# Altium project SaleemD_Project.PrjPcb (part 2 of 3)

## Sheet Power_Section.SchDoc
size A4; DocumentNumber: 2; SheetNumber: 2; SheetTotal: 6
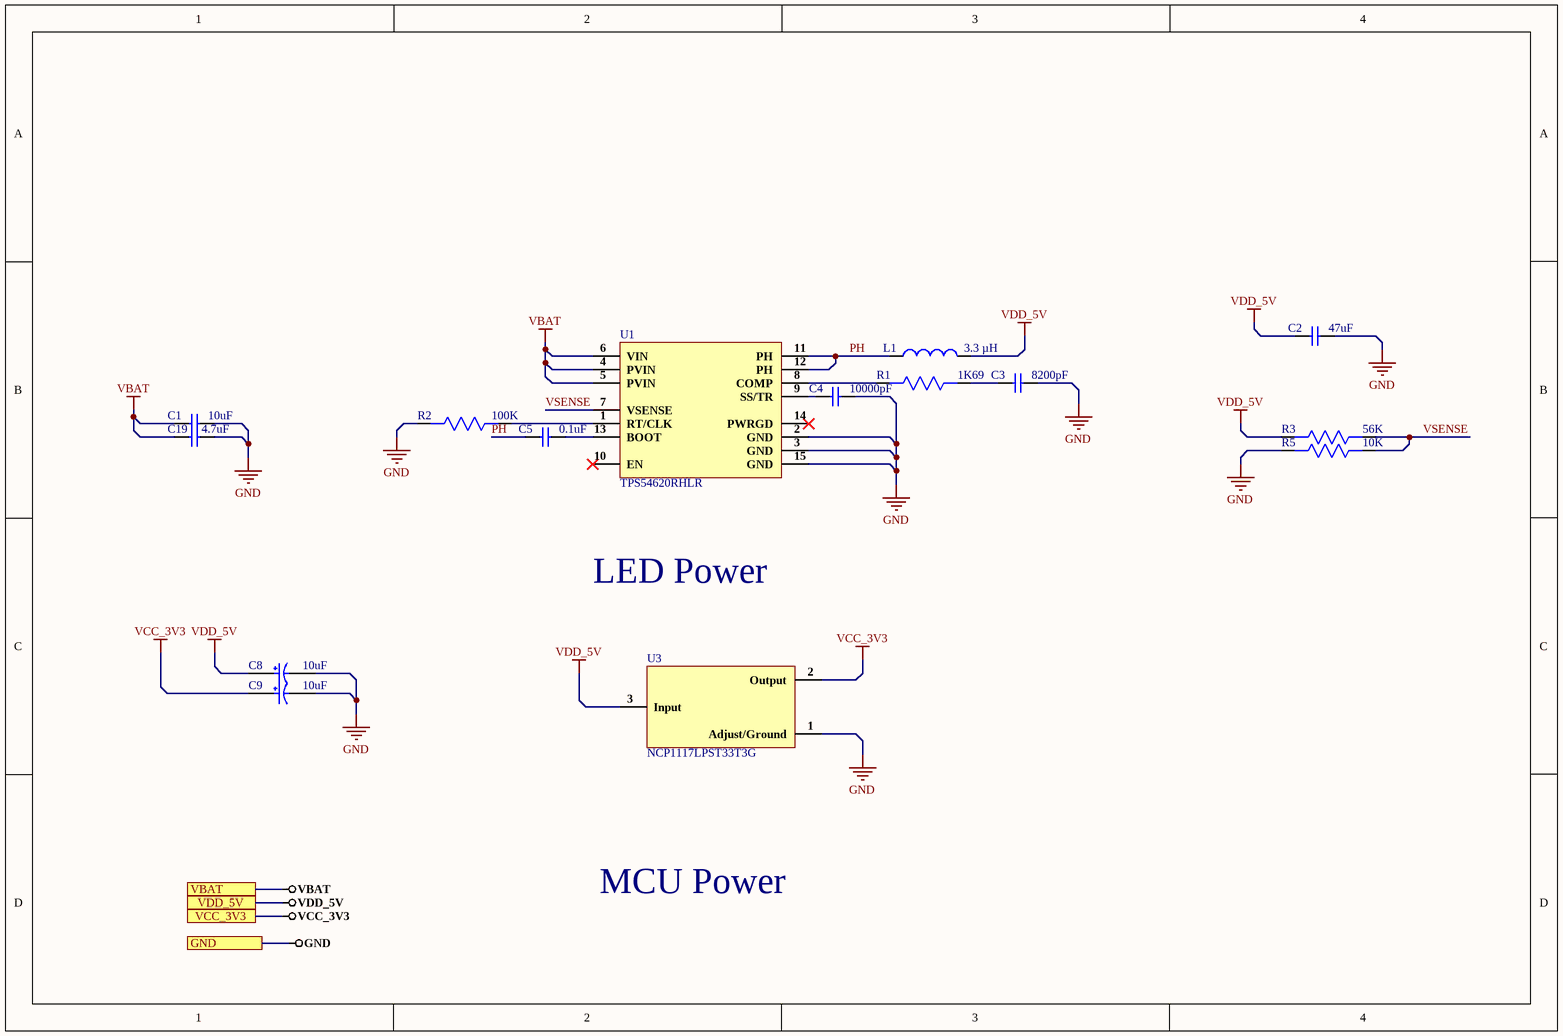
[diagram p2: Power_Section.SchDoc]

### Parts
C1  10uF  [Cap0603]
C2  47uF  [Cap1210]
C3  8200pF  [Cap0603]
C4  10000pF  [Cap0603]
C5  0.1uF  [Cap0603]
C8  10uF  [RVT1E100M0405]
C9  10uF  [RVT1E100M0405]
C19  4.7uF  [Cap0603]
L1  3.3 µH  [IHLP2525CZER3R3M01]
R1  1K69  [Res0603]
R2  100K  [Res0603]
R3  56K  [Res0603]
R5  10K  [Res0603]
U1  TPS54620RHLR  [14-VQFN (3.5x3.5)]
U3  NCP1117LPST33T3G  [SOT-223]

### Ports
GND, VBAT, VCC_3V3, VDD_5V

### Nets
GND: C1.2 C2.2 C3.2 C4.2 C8.2 C9.2 C19.2 R2.2 R5.2 U1.2(GND) U1.3(GND) U1.15(GND) U3.1(Adjust/Ground) ; port GND
VBAT: C1.1 C19.1 U1.4(PVIN) U1.5(PVIN) U1.6(VIN) ; port VBAT
VCC_3V3: C9.1 U3.2(Output) ; port VCC_3V3
VDD_5V: C2.1 C8.1 L1.2 R3.2 U3.3(Input) ; port VDD_5V
PH: C5.1 L1.1 U1.11(PH) U1.12(PH)
VSENSE: R3.1 R5.1 U1.7(VSENSE)
NetC3_1: C3.1 R1.1
NetC4_1: C4.1 U1.9(SS/TR)
NetC5_2: C5.2 U1.13(BOOT)
NetR1_2: R1.2 U1.8(COMP)
NetR2_1: R2.1 U1.1(RT/CLK)

Not connected (* = marked no-connect by the designer): U1 10(EN)* 14(PWRGD)*

### Notes on the sheet
- LED Power
- MCU Power

### Library data of the parts
C1 = GRM188R6YA106MA73D: CAP CER 10UF 35V X5R 0603; Manufacturer: Murata; Tolerance: 20%; Supplier 1: Digi-Key; Manufacturer Part Number: GRM188R6YA106MA73D; Stock 1: 11640; Pricing 1: 1=0.5, 10=0.346, 100=0.2076, 500=0.1557, 1000=0.13148 (USD); Mount: Surface Mount; Case/Package: 0603; Case Code (Metric): 1608; Case Code (Imperial): 0603; Min Operating Temperature: -55°C; Max Operating Temperature: 85°C; Packaging: Tape and Reel; Capacitance: 10uF; Voltage Rating: 35V; Voltage Rating (DC): 35V; Dielectric: X5R; Length: 0.063inch; Width: 0.031inch; Thickness: 0.039inch; ComponentLink1URL: http://search.murata.co.jp/Ceramy/image/img/A01X/G101/ENG/GRM188R6YA106MA73-01.pdf?src-supplier=Digi-Key; ComponentLink1Description: http://search.murata.co.jp/Ceramy/image/img/A01X/G101/ENG/GRM188R6YA106MA73-01.pdf?src-supplier=Digi-Key; ComponentLink2URL: http://search.murata.co.jp/Ceramy/image/img/A01X/G101/ENG/GRM188R6YA106MA73-01.pdf?src-supplier=Mouser; ComponentLink2Description: http://search.murata.co.jp/Ceramy/image/img/A01X/G101/ENG/GRM188R6YA106MA73-01.pdf?src-supplier=Mouser; ComponentLink3URL: https://www.murata.com/~/media/webrenewal/support/library/catalog/products/capacitor/mlcc/c02e.ashx?la=en-us&src-supplier=Digi-Key; ComponentLink3Description: https://www.murata.com/~/media/webrenewal/support/library/catalog/products/capacitor/mlcc/c02e.ashx?la=en-us&src-supplier=Digi-Key; ComponentLink4URL: http://search.murata.co.jp/Ceramy/image/img/A01X/G101/ENG/GRM188R6YA106MA73-01.pdf?src-supplier=Future+Electronics; ComponentLink4Description: http://search.murata.co.jp/Ceramy/image/img/A01X/G101/ENG/GRM188R6YA106MA73-01.pdf?src-supplier=Future+Electronics; ComponentLink5URL: http://search.murata.co.jp/Ceramy/image/img/A01X/G101/ENG/GRM188R6YA106MA73-01.pdf?src-supplier=TTI; ComponentLink5Description: http://search.murata.co.jp/Ceramy/image/img/A01X/G101/ENG/GRM188R6YA106MA73-01.pdf?src-supplier=TTI; Supplier Part Number 1: 490-13248-6-ND
C2 = TMK325ABJ476MM-P: CAP CER 47uF 25V 1210; Manufacturer: Taiyo Yuden; Dielectric: X5R; Tolerance: 20%; Supplier 1: RSComponents; Manufacturer Part Number: TMK325ABJ476MM-P; RoHS: Yes; Category: Ceramic Capacitors; Stock 1: 1000; Pricing 1: 1000=0.37500 (GBP); Mount: Surface Mount; Case/Package: Ceramic; Contact Plating: Tin; Min Operating Temperature: -55°C; Max Operating Temperature: 85°C; Capacitance: 47uF; Termination: Wraparound; Packaging: Tape and Reel; Length: 3.2mm; Lead Free: Lead Free; RoHS Compliant: Yes; ComponentLink1URL: http://www.yuden.co.jp/productdata/catalog/en/mlcc_all_e.pdf?src-supplier=Avnet+Asia; ComponentLink1Description: http://www.yuden.co.jp/productdata/catalog/en/mlcc_all_e.pdf?src-supplier=Avnet+Asia; ComponentLink2URL: http://ds.yuden.co.jp/TYCOMPAS/ut/detail.do?productNo=TMK325ABJ476MM-P&fileName=TMK325ABJ476MM-P_SS&mode=specSheetDownload&src-supplier=Digi-Key; ComponentLink2Description: http://ds.yuden.co.jp/TYCOMPAS/ut/detail.do?productNo=TMK325ABJ476MM-P&fileName=TMK325ABJ476MM-P_SS&mode=specSheetDownload&src-supplier=Digi-Key; ComponentLink3URL: https://ds.yuden.co.jp/TYCOMPAS/ut/detail?pn=TMK325ABJ476MM-P &amp;u=M&src-supplier=Digi-Key; ComponentLink3Description: https://ds.yuden.co.jp/TYCOMPAS/ut/detail?pn=TMK325ABJ476MM-P &amp;u=M&src-supplier=Digi-Key; Supplier Part Number 1: 1782936
C3 = CC0603KRX7R9BB822: CAP CER 8.2nF 50V X7R 10% 0603; Manufacturer: Yageo; Dielectric Material: Ceramic; Insulation Resistance: 100GR; Supplier 1: Digi-Key; Manufacturer Part Number: CC0603KRX7R9BB822; RoHS: Yes; Category: Ceramic Capacitors; Stock 1: 31159; Pricing 1: 1=0.10000, 10=0.07300, 50=0.03980, 100=0.03250, 500=0.02318, 1000=0.01822 (USD); Mount: Surface Mount; Case/Package: 0603; Case Code (Imperial): 0603; Case Code (Metric): 1608; Weight: 7.1E-05oz; Min Operating Temperature: -55°C; Max Operating Temperature: 125°C; Tolerance: 10%; Capacitance: 8.2nF; Dielectric: X7R; Voltage Rating: 50V; Voltage Rating (DC): 50V; Packaging: Tape and Reel; Termination: SMD/SMT; Resistor Type: Ceramic; Series: CC; Construction: Flat; Length: 1.6mm; Width: 0.031inch; Height: 0.8mm; Thickness: 0.035inch; Depth: 0.8mm; Radiation Hardening: No; REACH SVHC: Unknown; Lead Free: Lead Free; Halogen Free: Halogen Free; RoHS Compliant: Yes; ComponentLink1URL: https://datasheet.ciiva.com/11465/upy-gphc-x7r-6-3v-to-50v-8-11465276.pdf?src-supplier=Avnet; ComponentLink1Description: https://datasheet.ciiva.com/11465/upy-gphc-x7r-6-3v-to-50v-8-11465276.pdf?src-supplier=Avnet; ComponentLink2URL: https://datasheet.ciiva.com/17434/upy-gphc-x7r-6-3v-to-50v-8-17434493.pdf?src-supplier=Avnet+Europe; ComponentLink2Description: https://datasheet.ciiva.com/17434/upy-gphc-x7r-6-3v-to-50v-8-17434493.pdf?src-supplier=Avnet+Europe; ComponentLink3URL: https://datasheet.ciiva.com/8033/1489800-8033887.pdf?src-supplier=Element14; ComponentLink3Description: https://datasheet.ciiva.com/8033/1489800-8033887.pdf?src-supplier=Element14; ComponentLink4URL: https://datasheet.ciiva.com/13208/upy-gphc-x7r-6-3v-to-50v-8-12304-13208847.pdf?src-supplier=Mouser; ComponentLink4Description: https://datasheet.ciiva.com/13208/upy-gphc-x7r-6-3v-to-50v-8-12304-13208847.pdf?src-supplier=Mouser; Supplier Part Number 1: 311-1811-1-ND
C4 = CC0603KRX7R9BB103: CAP CER 10000PF 50V X7R 0603; Manufacturer: Yageo; Material: Ceramic; Tolerance: 10%; Capacitance: 10nF; Insulation Resistance: 100GR; Supplier 1: Digi-Key; Manufacturer Part Number: CC0603KRX7R9BB103; Stock 1: 8411467; Pricing 1: 1=0.1, 10=0.038, 100=0.0171, 500=0.01224, 1000=0.00962 (USD); Mount: Surface Mount; Case/Package: 0603; Number of Pins: 2; Case Code (Metric): 1608; Case Code (Imperial): 0603; Min Operating Temperature: -55°C; Max Operating Temperature: 125°C; Dielectric: X7R; Voltage: 50V; Packaging: Tape and Reel; Voltage Rating: 50V; Voltage Rating (DC): 50V; Package Quantity: 1; Termination: SMD/SMT; Composition: Ceramic; Length: 1.6mm; Height: 0.8mm; Width: 0.031inch; Thickness: 0.035inch; Depth: 0.8mm; Radiation Hardening: No; REACH SVHC: No SVHC; Lead Free: Lead Free; Halogen Free: Halogen Free; ComponentLink1URL: http://www.farnell.com/datasheets/1734573.pdf?src-supplier=Element14; ComponentLink1Description: http://www.farnell.com/datasheets/1734573.pdf?src-supplier=Element14; ComponentLink2URL: http://www.yageo.com/documents/recent/UPY-GPHC_X7R_6.3V-to-50V_18.pdf?src-supplier=Digi-Key; ComponentLink2Description: http://www.yageo.com/documents/recent/UPY-GPHC_X7R_6.3V-to-50V_18.pdf?src-supplier=Digi-Key; ComponentLink3URL: http://www.farnell.com/datasheets/2167236.pdf?src-supplier=Mouser; ComponentLink3Description: http://www.farnell.com/datasheets/2167236.pdf?src-supplier=Mouser; ComponentLink4URL: http://www.farnell.com/datasheets/70765.pdf?src-supplier=Element14; ComponentLink4Description: http://www.farnell.com/datasheets/70765.pdf?src-supplier=Element14; ComponentLink5URL: http://www.yageo.com/documents/recent/UPY-GPHC_X7R_6.3V-to-50V_8.pdf?src-supplier=Avnet+Europe; ComponentLink5Description: http://www.yageo.com/documents/recent/UPY-GPHC_X7R_6.3V-to-50V_8.pdf?src-supplier=Avnet+Europe; ComponentLink6URL: http://www.farnell.com/datasheets/1489800.pdf?src-supplier=Element14; ComponentLink6Description: http://www.farnell.com/datasheets/1489800.pdf?src-supplier=Element14; ComponentLink7URL: https://www.verical.com/server-webapp/html/getDatasheet?partID=403582&src-supplier=Verical; ComponentLink7Description: https://www.verical.com/server-webapp/html/getDatasheet?partID=403582&src-supplier=Verical; Supplier Part Number 1: 311-1085-6-ND
C5 = CC0603KRX7R0BB104: CAP CER 0.1UF 100V X7R 0603; Manufacturer: Yageo; Capacitance: 100nF; Tolerance: 10%; Supplier 1: Digi-Key; Manufacturer Part Number: CC0603KRX7R0BB104; RoHS: Yes; Category: Ceramic Capacitors; Stock 1: 60476; Pricing 1: 1=0.19000, 10=0.13500, 50=0.07680, 100=0.06370, 500=0.04466, 1000=0.03696 (USD); Mount: Surface Mount; Case/Package: 0603; Case Code (Metric): 1608; Case Code (Imperial): 0603; Weight: 7.1E-05oz; Min Operating Temperature: -55°C; Max Operating Temperature: 125°C; Package Quantity: 4000; Voltage Rating: 100V; Packaging: Tape and Reel; Dielectric: X7R; Termination: SMD/SMT; Resistor Type: Ceramic; Voltage Rating (DC): 100V; Series: CC; Length: 0.063inch; Width: 0.031inch; Thickness: 0.035inch; Depth: 0.8mm; Lead Free: Lead Free; RoHS Compliant: Yes; ComponentLink1URL: https://datasheet.ciiva.com/6277/mlccorderingcode-6277030.pdf?src-supplier=Digi-Key; ComponentLink1Description: https://datasheet.ciiva.com/6277/mlccorderingcode-6277030.pdf?src-supplier=Digi-Key; ComponentLink2URL: https://datasheet.ciiva.com/6277/mlccorderingcode-6277081.pdf?src-supplier=Digi-Key; ComponentLink2Description: https://datasheet.ciiva.com/6277/mlccorderingcode-6277081.pdf?src-supplier=Digi-Key; ComponentLink3URL: https://datasheet.ciiva.com/6277/mlccorderingcode-6277082.pdf?src-supplier=Digi-Key; ComponentLink3Description: https://datasheet.ciiva.com/6277/mlccorderingcode-6277082.pdf?src-supplier=Digi-Key; Supplier Part Number 1: 311-1523-1-ND
C8 C9 = RVT1E100M0405: CAP ALUM 10uF 25V SMD; Manufacturer: ROQANG; φD: 4mm; L: 5.4mm; Tolerance: ±20%; Operating Temperature: -45℃~+105℃; Rated Voltage: 25V; Capacitance: 10uF
C19 = C1608X5R1E475KT000E: CAP CER, 4.7 µF, 25 V, 0603; Manufacturer: TDK; Dielectric Material: Ceramic; Tolerance: 10%; Voltage Rating: 25V; Dielectric: X5R; Supplier 1: Digi-Key; Manufacturer Part Number: C1608X5R1E475KT000E; RoHS: No; Supplier Part Number 1: 2220Y1000562GCT-ND; Supplier 2: RSComponents; Category: Ceramic Capacitors; Stock 2: 16120; Pricing 2: 100=0.23400, 200=0.21900, 1000=0.20700, 2000=0.18700 (GBP); Mount: Surface Mount; Case/Package: 0603; Weight: 7.1E-05oz; Case Code (Metric): 1608; Case Code (Imperial): 0603; Min Operating Temperature: -55°C; Max Operating Temperature: 85°C; Termination: SMD/SMT; Resistor Type: Ceramic; Packaging: Tape and Reel; Capacitance: 4.7uF; Package Quantity: 4000; Voltage Rating (DC): 25V; Length: 1.6mm; Width: 0.031inch; Height: 0.8mm; Thickness: 0.039inch; Depth: 0.8mm; Lead Free: Lead Free; REACH SVHC: No SVHC; ComponentLink1URL: https://datasheet.ciiva.com/48587/6print-detail-pdf-phplangenpart-noc1608x5r1e475k080acimp-unit-xmhz-48587141.pdf?src-supplier=Onlinecomponents.com; ComponentLink1Description: https://datasheet.ciiva.com/48587/6print-detail-pdf-phplangenpart-noc1608x5r1e475k080acimp-unit-xmhz-48587141.pdf?src-supplier=Onlinecomponents.com; ComponentLink2URL: https://datasheet.ciiva.com/24216/mlcc-commercial-general-en-24216326.pdf?src-supplier=Mouser; ComponentLink2Description: https://datasheet.ciiva.com/24216/mlcc-commercial-general-en-24216326.pdf?src-supplier=Mouser; ComponentLink3URL: https://datasheet.ciiva.com/48671/mlcc-commercial-general-en-48671304.pdf?src-supplier=Avnet; ComponentLink3Description: https://datasheet.ciiva.com/48671/mlcc-commercial-general-en-48671304.pdf?src-supplier=Avnet; Supplier Part Number 2: 9159158P
L1 = IHLP2525CZER3R3M01: Ind High Current Shielded 3.3uH 20% 100KHz 6A 2525 T/R; Manufacturer: Vishay Dale; Core Material: Ferrite; DC Resistance (DCR): 30mR; Saturation Current: 13.5A; Self Resonant Frequency: 5MHz; Supplier 1: Digi-Key; Manufacturer Part Number: IHLP2525CZER3R3M01; RoHS: Yes; Category: Fixed Inductors; Stock 1: 8419; Pricing 1: 1=1.31000, 10=1.21600, 25=1.12200, 50=0.93500, 100=0.87890, 250=0.78540, 500=0.67320, 1000=0.59840 (USD); Mount: Surface Mount; Case/Package: 2525; Number of Pins: 2; Contact Plating: Tin; Case Code (Imperial): 2525; Case Code (Metric): 6363; Min Operating Temperature: -55°C; Max Operating Temperature: 125°C; Tolerance: 20%; Inductance: 3.3uH; Current Rating: 6A; Shielding: Shielded; Packaging: Tape and Reel; Inductance Tolerance: 20%; Test Frequency: 100kHz; Max DC Current: 6A; Termination: SMD/SMT; RMS Current (Irms): 6A; Package Quantity: 2000; Series: IHLP-2525CZ-01; Rated Current-Max: 6A; Length: 6.47mm; Width: 6.47mm; Height: 3mm; Depth: 6.72mm; Height - Seated (Max): 0.118inch; Radiation Hardening: No; Military Standard: Not; REACH SVHC: Unknown; Lead Free: Lead Free; RoHS Compliant: Yes; Supplier Part Number 1: 541-1009-1-ND
R1 = CR0603-FX-1691ELF: RES SMD 1.69K 0.1W 0603; Manufacturer: Bourns; Resistance: 1.69kR; Power Rating: 100mW; Tolerance: 1%; Voltage Rating: 50V; Temperature Coefficient: 100ppm/°C; Supplier 1: Digi-Key; Manufacturer Part Number: CR0603-FX-1691ELF; RoHS: Yes; Category: Chip SMD Resistors; Stock 1: 21457; Pricing 1: 1=0.10000, 10=0.03300, 100=0.01360, 1000=0.00610, 2500=0.00529 (USD); Mount: Surface Mount; Case/Package: 0603; Case Code (Metric): 1608; Case Code (Imperial): 0603; Contact Plating: Tin; Min Operating Temperature: -55°C; Max Operating Temperature: 155°C; Packaging: Tape and Reel; Package Quantity: 5000; Resistor Type: Thick Film; Number of Terminations: 2; Termination: SMD/SMT; Max Power Dissipation: 100mW; Features: Moisture Resistant; Series: CR0603; Construction: Rectangular; Length: 1.6mm; Width: 0.031inch; Height: 0.022inch; Depth: 0.8mm; Thickness: 457um; Radiation Hardening: No; Military Standard: Not; RoHS Compliant: Yes; ComponentLink1URL: http://components.arrow.com/part/dataview/0323_00459241?src-supplier=Arrow+Europe; ComponentLink1Description: http://components.arrow.com/part/dataview/0323_00459241?src-supplier=Arrow+Europe; ComponentLink2URL: http://www.mouser.com/ds/2/54/chpreztr-977002.pdf?src-supplier=Mouser; ComponentLink2Description: http://www.mouser.com/ds/2/54/chpreztr-977002.pdf?src-supplier=Mouser; ComponentLink3URL: http://www.onlinecomponents.com/datasheet/cr0603-fx-1691elf.aspx?p=10743832&src-supplier=Onlinecomponents.com; ComponentLink3Description: http://www.onlinecomponents.com/datasheet/cr0603-fx-1691elf.aspx?p=10743832&src-supplier=Onlinecomponents.com; ComponentLink4URL: http://components.arrow.com/part/dataview/40997510S2955917N1506?src-supplier=Arrow+Electronics; ComponentLink4Description: http://components.arrow.com/part/dataview/40997510S2955917N1506?src-supplier=Arrow+Electronics; ComponentLink5URL: http://www.bourns.com/docs/Product-Datasheets/CHPREZTR.pdf?src-supplier=Digi-Key; ComponentLink5Description: http://www.bourns.com/docs/Product-Datasheets/CHPREZTR.pdf?src-supplier=Digi-Key; ComponentLink6URL: http://www.bourns.com/pdfs/chpreztr.pdf?src-supplier=Avnet; ComponentLink6Description: http://www.bourns.com/pdfs/chpreztr.pdf?src-supplier=Avnet; ComponentLink7URL: https://www.bourns.com/docs/Product-Datasheets/CHPREZTR.pdf?src-supplier=Digi-Key; ComponentLink7Description: https://www.bourns.com/docs/Product-Datasheets/CHPREZTR.pdf?src-supplier=Digi-Key; Supplier Part Number 1: CR0603-FX-1691ELFCT-ND
R2 = CRGH0603J100K: RES SMD 100K OHM 5% 1/5W 0603; Manufacturer: TE Connectivity; Resistance: 100kR; Temperature Coefficient: 100ppm/°C; Power Rating: 200mW; Voltage Rating: 50V; Number of Resistors: 1; Supplier 1: Digi-Key; Manufacturer Part Number: CRGH0603J100K; Stock 1: 23277; Pricing 1: 1=0.1, 10=0.049, 100=0.02, 1000=0.00899, 2500=0.0078 (USD); Mount: Surface Mount; Case/Package: 0603; Case Code (Imperial): 0603; Case Code (Metric): 1608; Min Operating Temperature: -55°C; Max Operating Temperature: 125°C; Tolerance: 5%; Packaging: Tape and Reel; Resistor Type: Thick Film,Power resistor; Number of Terminations: 2; Series: CRGH; Termination: Solder; Voltage Rating (DC): 50V; Resistance Tolerance: 5%; Technology: THICK FILM; Length: 1.6mm; Width: 0.8mm; Height: 0.45mm; Depth: 0.8mm; RoHS Compliant: Yes; REACH SVHC: No SVHC; ELV: Compliant; ComponentLink1URL: http://www.farnell.com/datasheets/2007183.pdf?src-supplier=Element14; ComponentLink1Description: http://www.farnell.com/datasheets/2007183.pdf?src-supplier=Element14; Supplier Part Number 1: A126393DKR-ND
R3 = RC0603JR-0756KL: RES SMD 0603 56K Ohm 5% 0.1W; Manufacturer: Yageo; Resistance: 56kR; Power Rating: 100mW; Voltage Rating: 50V; Temperature Coefficient: 100ppm/°C; Working Voltage: 75V; Supplier 1: Digi-Key; Manufacturer Part Number: RC0603JR-0756KL; RoHS: Yes; Category: Chip SMD Resistors; Stock 1: 305962; Pricing 1: 1=0.10000, 10=0.02000, 100=0.00800, 1000=0.00360, 2500=0.00312 (USD); Case/Package: 0603; Number of Pins: 2; Case Code (Imperial): 0603; Case Code (Metric): 1608; Min Operating Temperature: -55°C; Max Operating Temperature: 155°C; Package Quantity: 1; Tolerance: 5%; Voltage Rating (DC): 50V; Packaging: Tape and Reel; Termination: SMD/SMT; Resistor Type: Thick Film; Number of Terminations: 2; Max Power Dissipation: 100mW; Features: Moisture Resistant; Series: RC; Resistance Tolerance: 5%; Construction: Rectangular; Technology: THICK FILM; Length: 1.6mm; Width: 0.031inch; Height: 0.022inch; Depth: 0.8mm; REACH SVHC: No SVHC; Military Standard: Not; Lead Free: Lead Free; RoHS Compliant: Yes; ComponentLink1URL: https://datasheet.ciiva.com/7746/443971-7746519.pdf?src-supplier=Element14; ComponentLink1Description: https://datasheet.ciiva.com/7746/443971-7746519.pdf?src-supplier=Element14; ComponentLink2URL: https://datasheet.ciiva.com/15189/getdatasheetpartid-326541-15189879.pdf?src-supplier=Verical; ComponentLink2Description: https://datasheet.ciiva.com/15189/getdatasheetpartid-326541-15189879.pdf?src-supplier=Verical; ComponentLink3URL: https://datasheet.ciiva.com/7746/443971-7746520.pdf?src-supplier=Element14; ComponentLink3Description: https://datasheet.ciiva.com/7746/443971-7746520.pdf?src-supplier=Element14; ComponentLink4URL: https://datasheet.ciiva.com/2452/pyu-r-int-thick-7-2452986.pdf?src-supplier=Digi-Key; ComponentLink4Description: https://datasheet.ciiva.com/2452/pyu-r-int-thick-7-2452986.pdf?src-supplier=Digi-Key; ComponentLink5URL: https://datasheet.ciiva.com/2452/pyu-r-int-thick-7-2452987.pdf?src-supplier=Digi-Key; ComponentLink5Description: https://datasheet.ciiva.com/2452/pyu-r-int-thick-7-2452987.pdf?src-supplier=Digi-Key; ComponentLink6URL: https://datasheet.ciiva.com/2452/pyu-r-int-thick-7-2452988.pdf?src-supplier=Digi-Key; ComponentLink6Description: https://datasheet.ciiva.com/2452/pyu-r-int-thick-7-2452988.pdf?src-supplier=Digi-Key; Supplier Part Number 1: 311-56KGRCT-ND
R5 = RC0603FR-0710KL: RES SMD 10K OHM 1% 1/10W 0603; Manufacturer: Yageo; Resistance: 10kR; Temperature Coefficient: 100ppm/°C; Voltage Rating (DC): 50V; Power Rating: 100mW; Voltage Rating: 75V; Supplier 1: Digi-Key; Manufacturer Part Number: RC0603FR-0710KL; Stock 1: 144725424; Pricing 1: 1=0.1, 10=0.024, 100=0.0097, 1000=0.00437, 2500=0.00379 (USD); Case/Package: 0603; Number of Pins: 2; Weight: 7.1E-05oz; Case Code (Imperial): 0603; Case Code (Metric): 1608; Min Operating Temperature: -55°C; Max Operating Temperature: 155°C; Tolerance: 1%; Composition: Thick Film; Packaging: Tape and Reel; Military Standard: Not; Termination: SMD/SMT; Length: 1.6mm; Height: 0.45mm; Width: 0.8mm; Depth: 0.8mm; Lead Pitch: 0.3mm; REACH SVHC: No SVHC; Lead Free: Lead Free; ComponentLink1URL: http://www.farnell.com/datasheets/38590.pdf?src-supplier=Element14; ComponentLink1Description: http://www.farnell.com/datasheets/38590.pdf?src-supplier=Element14; ComponentLink2URL: https://www.verical.com/server-webapp/html/getDatasheet?partID=409289&src-supplier=Verical; ComponentLink2Description: https://www.verical.com/server-webapp/html/getDatasheet?partID=409289&src-supplier=Verical; ComponentLink3URL: http://www.farnell.com/datasheets/1868787.pdf?src-supplier=Element14; ComponentLink3Description: http://www.farnell.com/datasheets/1868787.pdf?src-supplier=Element14; ComponentLink4URL: http://www.farnell.com/datasheets/2167052.pdf?src-supplier=Element14; ComponentLink4Description: http://www.farnell.com/datasheets/2167052.pdf?src-supplier=Element14; ComponentLink5URL: http://www.farnell.com/datasheets/443971.pdf?src-supplier=Element14; ComponentLink5Description: http://www.farnell.com/datasheets/443971.pdf?src-supplier=Element14; Supplier Part Number 1: 311-10.0KHRDKR-ND
U1 = TPS54620RHLR: IC REG BUCK ADJUSTABLE 6A 14VQFN; Manufacturer: Texas Instruments; Number of Outputs: 1; Output Voltage: 15V; Min Input Voltage: 1.6V; Max Input Voltage: 17V; Switching Frequency: 1.6MHz; Min Supply Voltage: 4.5V; Synchronous Rectifier: Yes; Min Output Voltage: 800mV; Quiescent Current: 600uA; Supplier 1: Digi-Key; Manufacturer Part Number: TPS54620RHLR; RoHS: Yes; Category: Voltage Regulators - Switching; Pricing 1: 1=5.80000, 10=5.20700, 25=4.92280, 100=4.26630, 250=4.04752, 500=3.63182, 1000=3.61200 (USD); Mount: Surface Mount; Case/Package: QFN; Number of Pins: 14; Contact Plating: Gold; Min Operating Temperature: -40°C; Max Operating Temperature: 150°C; Max Output Current: 6A; Operating Supply Voltage: 17V; Output Current: 6A; Packaging: Tape and Reel; Package Quantity: 3000; Max Output Voltage: 15V; Output Type: Adjustable; Series: SWIFT™; Length: 3.65mm; Width: 3.65mm; Height: 0.95mm; Radiation Hardening: No; REACH SVHC: No SVHC; Lead Free: Lead Free; RoHS Compliant: Yes; ComponentLink1URL: https://datasheet.ciiva.com/2026/tps54620-2026364.pdf?src-supplier=Digi-Key; ComponentLink1Description: https://datasheet.ciiva.com/2026/tps54620-2026364.pdf?src-supplier=Digi-Key; ComponentLink2URL: https://datasheet.ciiva.com/22716/1781687-22716300.pdf?src-supplier=Element14; ComponentLink2Description: https://datasheet.ciiva.com/22716/1781687-22716300.pdf?src-supplier=Element14; ComponentLink3URL: https://datasheet.ciiva.com/2026/tps54620-2026365.pdf?src-supplier=Digi-Key; ComponentLink3Description: https://datasheet.ciiva.com/2026/tps54620-2026365.pdf?src-supplier=Digi-Key; ComponentLink4URL: https://datasheet.ciiva.com/26101/tps54620-26101515.pdf?src-supplier=Avnet+Europe; ComponentLink4Description: https://datasheet.ciiva.com/26101/tps54620-26101515.pdf?src-supplier=Avnet+Europe; ComponentLink5URL: https://datasheet.ciiva.com/3221/tps54620-3221357.pdf?src-supplier=Avnet; ComponentLink5Description: https://datasheet.ciiva.com/3221/tps54620-3221357.pdf?src-supplier=Avnet; ComponentLink6URL: https://datasheet.ciiva.com/2026/tps54620-2026366.pdf?src-supplier=Digi-Key; ComponentLink6Description: https://datasheet.ciiva.com/2026/tps54620-2026366.pdf?src-supplier=Digi-Key; Supplier Part Number 1: 296-28831-1-ND
U3 = NCP1117LPST33T3G: IC REG LINEAR 3.3V 1A SOT223; Manufacturer: ON Semiconductor; Dropout Voltage: 1.3V; Number of Outputs: 1; Min Input Voltage: -300mV; Max Input Voltage: 18V; Min Current Limit: 1.1A; Quiescent Current: 700uA; Reference Voltage: 1.275V; Polarity: Positive; Power Supply Rejection Ratio (PSRR): 60dB; Output Type: Fixed; Supplier 1: Digi-Key; Manufacturer Part Number: NCP1117LPST33T3G; RoHS: Yes; Category: Voltage Regulators - Linear; Stock 1: 2017; Pricing 1: 1=0.44000, 10=0.37400, 25=0.34920, 100=0.27930, 250=0.25932, 500=0.21944, 1000=0.16957 (USD); Mount: Surface Mount; Case/Package: SOT-223; Number of Pins: 3; Contact Plating: Tin,Matte; Min Operating Temperature: 0°C; Max Operating Temperature: 125°C; Packaging: Tape and Reel; Output Voltage: 3.3V; Package Quantity: 1; Max Output Current: 1A; Output Current: 1A; Number of Regulators: 1; Min Output Voltage: 3.3V; Nominal Output Voltage: 3.3V; Series: -; Length: 6.7mm; Width: 3.7mm; Height: 1.69mm; REACH SVHC: No SVHC; Lead Free: Lead Free; Halogen Free: Halogen Free; RoHS Compliant: Yes; ComponentLink1URL: https://datasheet.ciiva.com/6590/ncp1117lp-d-6590870.pdf?src-supplier=Digi-Key; ComponentLink1Description: https://datasheet.ciiva.com/6590/ncp1117lp-d-6590870.pdf?src-supplier=Digi-Key; ComponentLink2URL: https://datasheet.ciiva.com/16468/ncp1117lp-d-16468566.pdf?src-supplier=Future+Electronics; ComponentLink2Description: https://datasheet.ciiva.com/16468/ncp1117lp-d-16468566.pdf?src-supplier=Future+Electronics; ComponentLink3URL: https://datasheet.ciiva.com/6590/ncp1117lp-d-6590872.pdf?src-supplier=Digi-Key; ComponentLink3Description: https://datasheet.ciiva.com/6590/ncp1117lp-d-6590872.pdf?src-supplier=Digi-Key; ComponentLink4URL: https://datasheet.ciiva.com/6590/ncp1117lp-d-6590873.pdf?src-supplier=Digi-Key; ComponentLink4Description: https://datasheet.ciiva.com/6590/ncp1117lp-d-6590873.pdf?src-supplier=Digi-Key; ComponentLink5URL: https://datasheet.ciiva.com/8233/ncp1117lp-d-8233561.pdf?src-supplier=Avnet; ComponentLink5Description: https://datasheet.ciiva.com/8233/ncp1117lp-d-8233561.pdf?src-supplier=Avnet; ComponentLink6URL: https://datasheet.ciiva.com/8231/ncp1117lp-d-8231034.pdf?src-supplier=Avnet; ComponentLink6Description: https://datasheet.ciiva.com/8231/ncp1117lp-d-8231034.pdf?src-supplier=Avnet; ComponentLink7URL: https://datasheet.ciiva.com/4887/ncp1117lp-d-82673-4887580.pdf?src-supplier=Mouser; ComponentLink7Description: https://datasheet.ciiva.com/4887/ncp1117lp-d-82673-4887580.pdf?src-supplier=Mouser; Supplier Part Number 1: NCP1117LPST33T3GOSCT-ND

## Sheet Opto_Section.SchDoc
size A4; DocumentNumber: 5; SheetNumber: 5; SheetTotal: 6
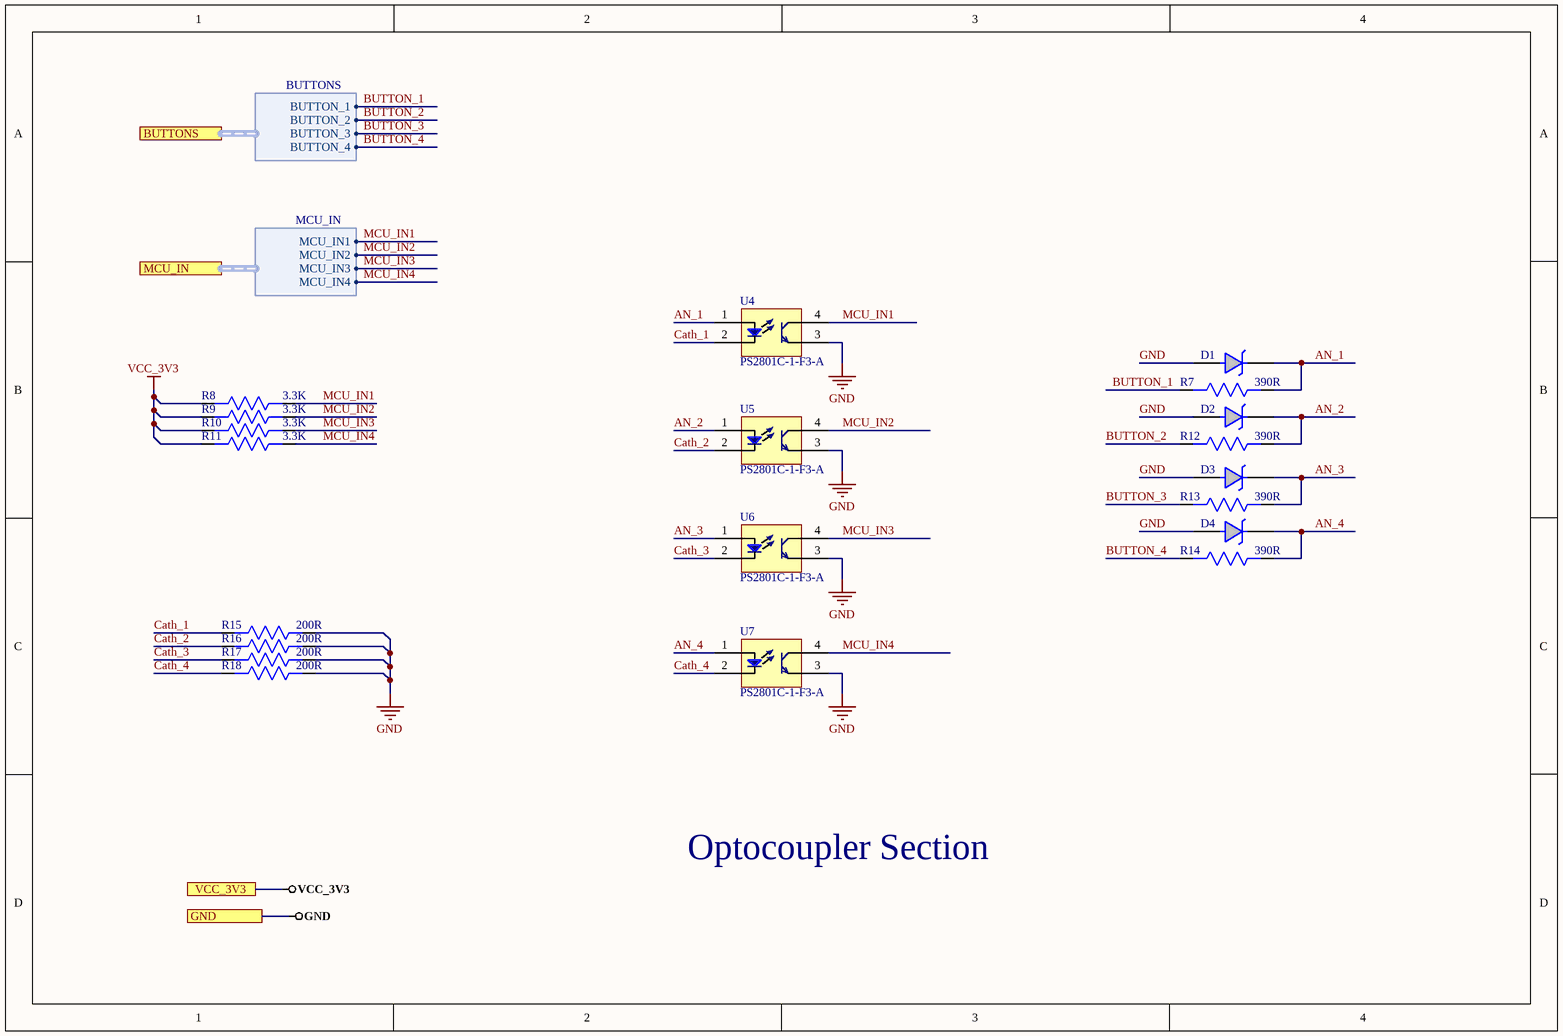
[diagram p3: Opto_Section.SchDoc]

### Parts
D1  MM3Z3V3B  [MM3Z3V3B]  (value not drawn)
D2  MM3Z3V3B  [MM3Z3V3B]  (value not drawn)
D3  MM3Z3V3B  [MM3Z3V3B]  (value not drawn)
D4  MM3Z3V3B  [MM3Z3V3B]  (value not drawn)
R7  390R  [RES 2512]
R8  3.3K  [Res0603]
R9  3.3K  [Res0603]
R10  3.3K  [Res0603]
R11  3.3K  [Res0603]
R12  390R  [RES 2512]
R13  390R  [RES 2512]
R14  390R  [RES 2512]
R15  200R  [Res0603]
R16  200R  [Res0603]
R17  200R  [Res0603]
R18  200R  [Res0603]
U4  PS2801C-1-F3-A  [PS2801C-1-F3-A]
U5  PS2801C-1-F3-A  [PS2801C-1-F3-A]
U6  PS2801C-1-F3-A  [PS2801C-1-F3-A]
U7  PS2801C-1-F3-A  [PS2801C-1-F3-A]

### Ports
BUTTONS (harness BUTTONS), GND, MCU_IN (harness MCU_IN), VCC_3V3

### Harnesses
MCU_IN: MCU_IN1, MCU_IN2, MCU_IN3, MCU_IN4
BUTTONS: BUTTON_1, BUTTON_2, BUTTON_3, BUTTON_4

### Nets
GND: D1.1(ANODE) D2.1(ANODE) D3.1(ANODE) D4.1(ANODE) R15.1 R16.1 R17.1 R18.1 U4.3(E) U5.3(E) U6.3(E) U7.3(E) ; port GND
VCC_3V3: R8.2 R9.2 R10.2 R11.2 ; port VCC_3V3
AN_1: D1.2(CATHODE) R7.1 U4.1(An)
AN_2: D2.2(CATHODE) R12.1 U5.1(An)
AN_3: D3.2(CATHODE) R13.1 U6.1(An)
AN_4: D4.2(CATHODE) R14.1 U7.1(An)
BUTTON_1: R7.2 ; port BUTTONS.BUTTON_1
BUTTON_2: R12.2 ; port BUTTONS.BUTTON_2
BUTTON_3: R13.2 ; port BUTTONS.BUTTON_3
BUTTON_4: R14.2 ; port BUTTONS.BUTTON_4
Cath_1: R15.2 U4.2(Ca)
Cath_2: R16.2 U5.2(Ca)
Cath_3: R17.2 U6.2(Ca)
Cath_4: R18.2 U7.2(Ca)
MCU_IN1: R8.1 U4.4(C) ; port MCU_IN.MCU_IN1
MCU_IN2: R9.1 U5.4(C) ; port MCU_IN.MCU_IN2
MCU_IN3: R10.1 U6.4(C) ; port MCU_IN.MCU_IN3
MCU_IN4: R11.1 U7.4(C) ; port MCU_IN.MCU_IN4

### Notes on the sheet
- Optocoupler Section

### Library data of the parts
D1-D4 = MM3Z3V3B: DIODE ZENER 3.3V 200MW SOD323F; Manufacturer: ON Semiconductor / Fairchild; Forward Voltage: 1V; Tolerance: 2%; Impedance: 89R; Max Reverse Leakage Current: 4.5uA; Test Current: 5mA; Element Configuration: Single; Supplier 1: Digi-Key; Manufacturer Part Number: MM3Z3V3B; Stock 1: 473644; Pricing 1: 1=0.22, 10=0.18, 100=0.0956, 500=0.06288, 1000=0.04276 (USD); Mount: Surface Mount; Number of Pins: 2; Weight: 0.0276g; Min Operating Temperature: -65°C; Max Operating Temperature: 150°C; Packaging: Tape and Reel; Package Quantity: 1; Max Power Dissipation: 200mW; Zener Voltage: 3.3V; Voltage Tolerance: 2%; Power Dissipation: 200mW; Working Voltage: 3.3V; Peak Reverse Current: 4.5uA; Length: 1.3mm; Height: 1mm; Width: 1.7mm; Radiation Hardening: No; REACH SVHC: No SVHC; Lead Free: Lead Free; ComponentLink1URL: http://www.onsemi.com/pub/Collateral/MM3Z9V1B-D.pdf?src-supplier=Digi-Key; ComponentLink1Description: http://www.onsemi.com/pub/Collateral/MM3Z9V1B-D.pdf?src-supplier=Digi-Key; ComponentLink2URL: http://www.mouser.com/ds/2/149/MM3Z3V3B-187166.pdf?src-supplier=Mouser; ComponentLink2Description: http://www.mouser.com/ds/2/149/MM3Z3V3B-187166.pdf?src-supplier=Mouser; ComponentLink3URL: https://www.fairchildsemi.com/datasheets/MM/MM3Z9V1B.pdf?src-supplier=Avnet; ComponentLink3Description: https://www.fairchildsemi.com/datasheets/MM/MM3Z9V1B.pdf?src-supplier=Avnet; ComponentLink4URL: http://www.farnell.com/datasheets/1706525.pdf?src-supplier=Element14; ComponentLink4Description: http://www.farnell.com/datasheets/1706525.pdf?src-supplier=Element14; Supplier Part Number 1: MM3Z3V3BCT-ND
R7 R12-R14 = 25121WF3900T4E: Resistors 200V 390Ω 2512 Chip Resistor SMD; Manufacturer: UNI-ROYAL; Manufacturer Part No: 25121WF3900T4E; Package: 2512; Value: 390Ω; ComponentLink1Description: LCSC; ComponentLink1URL: https://lcsc.com/product-detail/Chip-span-style-background-color-ff0-Resistor-span-Surface-Mount_UNI-ROYAL-Uniroyal-Elec-25121WF3900T4E_C60131.html
R8-R11 = RC0603FR-073K3L: RES SMD 3.3K OHM 1% 1/10W 0603; Manufacturer: Yageo Phycomp; Temperature Coefficient: 100ppm/°C; Resistance: 3.3kR; Voltage Rating (DC): 50V; Power Rating: 100mW; Supplier 1: Digi-Key; Manufacturer Part Number: RC0603FR-073K3L; Stock 1: 6863000; Pricing 1: 1=0.1, 10=0.024, 100=0.0097, 1000=0.00437, 2500=0.00379 (USD); Mount: Surface Mount; Case/Package: 0603; Number of Pins: 2; Min Operating Temperature: -55°C; Max Operating Temperature: 155°C; Tolerance: 1%; Packaging: Cut Tape; Length: 1.6mm; Height: 0.45mm; Width: 800um; Depth: 0.8mm; REACH SVHC: No SVHC; Lead Free: Lead Free; Supplier Part Number 1: 311-3.30KHRCT-ND
R15-R18 = RT0603DRD07200RL: RES SMD 200 OHM 0.5% 1/10W 0603; Manufacturer: Yageo; Power Rating: 100mW; Voltage Rating (DC): 50V; Supplier 1: Digi-Key; Manufacturer Part Number: RT0603DRD07200RL; Stock 1: 19572; Pricing 1: 1=0.21, 10=0.174, 100=0.0682, 1000=0.02855, 2500=0.02617 (USD); Case/Package: 0603; Resistance: 200R; Tolerance: 0.5%; Packaging: Cut Tape; Lead Free: Lead Free; Supplier Part Number 1: 311-200DCT-ND
U4-U7 = PS2801C-1-F3-A: TransistorOptocouplers DC 1 2500Vrms SOP-4_P1.27 Optocouplers RoHS; Manufacturer: CEL; Number of Channels: 1; Collector Emitter Voltage (VCEO): 300mV; Forward Voltage: 1.2V; Max Power Dissipation: 120mW; Max Collector Current: 30mA; Max Output Voltage: 80V; Supplier 1: Digi-Key; Manufacturer Part Number: PS2801C-1-F3-A; Stock 1: 399; Pricing 1: 1=0.77, 10=0.595, 100=0.3825 (USD); Mount: Surface Mount; Case/Package: SOIC; Number of Pins: 4; Min Operating Temperature: -55°C; Max Operating Temperature: 100°C; Packaging: Tape and Reel; Collector Emitter Saturation Voltage: 300mV; Package Quantity: 1; Output Current per Channel: 30mA; Lead Free: Lead Free; ComponentLink1URL: http://www.cel.com/pdf/datasheets/PS2801C-1,PS2801C-4.pdf?src-supplier=Digi-Key; ComponentLink1Description: http://www.cel.com/pdf/datasheets/PS2801C-1,PS2801C-4.pdf?src-supplier=Digi-Key; ComponentLink2URL: http://www.cel.com/pdf/datasheets/how_to_order_optos.pdf?src-supplier=Digi-Key; ComponentLink2Description: http://www.cel.com/pdf/datasheets/how_to_order_optos.pdf?src-supplier=Digi-Key; ComponentLink3URL: http://datasheet.iiic.cc/cel/PS2801C-1-F3-A.pdf?src-supplier=IIIC; ComponentLink3Description: http://datasheet.iiic.cc/cel/PS2801C-1-F3-A.pdf?src-supplier=IIIC; Supplier Part Number 1: PS2801C-1-F3-ACT-ND